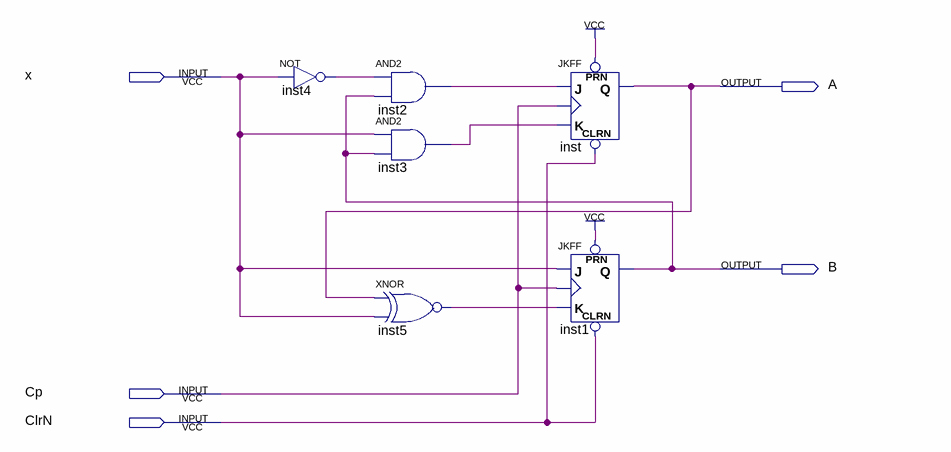
[diagram p0: schematic sheet]
// Quartus schematic Design_Sequential_Circuit.bdf as structural Verilog: 6 symbols, 5 pins
module Design_Sequential_Circuit (
  input  x,
  input  Cp,
  input  ClrN,
  output A,
  output B
);

  wire inst2_out, inst3_out, inst4_out, inst5_out;

  not inst4 (inst4_out, x);
  and inst2 (inst2_out, inst4_out, B);
  and inst3 (inst3_out, x, B);
  xnor inst5 (inst5_out, A, x);
  JKFF inst (.PRN(1'b1), .CLRN(ClrN), .K(inst3_out), .J(inst2_out), .CLK(Cp), .Q(A));
  JKFF inst1 (.PRN(1'b1), .CLRN(ClrN), .K(inst5_out), .J(x), .CLK(Cp), .Q(B));
endmodule
